# Altium schematic sheet CAN_BUS_PCA82C251T.SchDoc
size A3
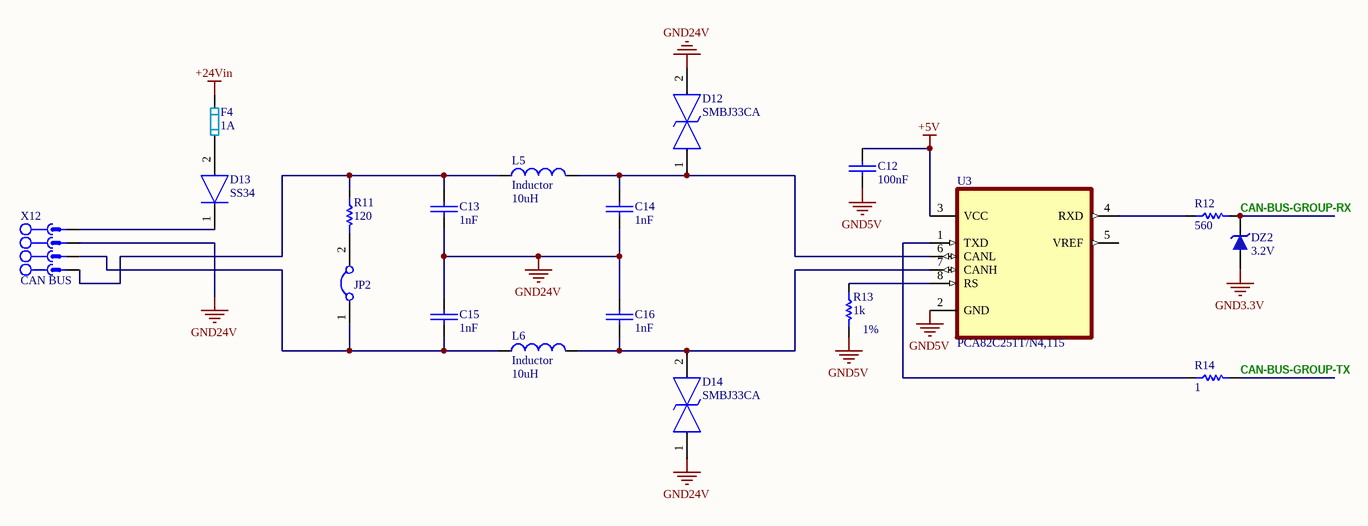
[diagram p0: CAN_BUS_PCA82C251T.SchDoc]

## Parts
C12  100nF  [CAP_SMD_0805]
C13  1nF  [CAP_SMD_0805]
C14  1nF  [CAP_SMD_0805]
C15  1nF  [CAP_SMD_0805]
C16  1nF  [CAP_SMD_0805]
D12  SMBJ33CA  [DIONM5436X261N]
D13  SS34  [DIOM6959X262N]
D14  SMBJ33CA  [DIONM5436X261N]
DZ2  3.2V  [SOD80, LL-34]
F4  value 1A  [Reset Fuse]  (hidden comment: FUSE)
JP2  Jumper  [Jumper Small - 2.54 - GRAY]  (value not drawn)
L5  Inductor  value 10uH  [INDC1206]
L6  Inductor  value 10uH  [INDC1206]
R11  120  [RES 0805 (2012X06L)]
R12  560  [RES 0805 (2012X06L)]
R13  Tolerance: 1%  [RES 0805 (2012X06L)]  (hidden comment: 1k)
R14  1  [RES 0805 (2012X06L)]
U3  PCA82C251T/N4,115  [SOIC127P600X175-8N]
X12  CAN BUS  [CON_MSTBA04]

## Nets
+5V: C12.1(+) U3.3(VCC)
+24Vin: F4.2
GND3.3V: DZ2.1
GND5V: C12.2(-) R13.2 U3.2(GND)
GND24V: C13.2(-) C14.2(-) C15.1(+) C16.1(+) D12.2 D14.1 X12.3
CAN-BUS-GROUP-RX: DZ2.2 R12.2
CAN-BUS-GROUP-TX: R14.2
NetC13_1: C13.1(+) L5.1 R11.1 X12.1
NetC14_1: C14.1(+) D12.1 L5.2 U3.6(CANL)
NetC15_2: C15.2(-) JP2.1 L6.1 X12.2
NetC16_2: C16.2(-) D14.2 L6.2 U3.7(CANH)
NetD13_1: D13.1(K) X12.4
NetD13_2: D13.2(A) F4.1
NetJP2_2: JP2.2 R11.2
NetR12_1: R12.1 U3.4(RXD)
NetR13_1: R13.1 U3.8(RS)
NetR14_1: R14.1 U3.1(TXD)

Not connected (* = marked no-connect by the designer): U3 5(VREF)

## Notes on the sheet
- Title
- Size:
- Date:
- A3
- Number:
- Time:
- Revision:
- Sheet
- of
- File:

## Library data of the parts
C12 = Cap-Bipolar: Bipolar Capacitor; Voltage: 100V; Designer: Saeid Jorablo; Organazation: ControTec; Adding Date: 1387/12/20; Value: 100nF
C13-C16 = Cap-Bipolar: Bipolar Capacitor; Voltage: 50V; Value: 1nF
D12 D14 = SMBJ33CA: TVS Diode (Bi-directional); Manufacturer_Name: LITTELFUSE; Datasheet Link: https://www.arrow.com/en/products/smbj33ca/littelfuse; Height: 2.61mm; Manufacturer_Part_Number: SMBJ33CA; Mouser Part Number: 576-SMBJ33CA; Mouser Price/Stock: https://www.mouser.co.uk/ProductDetail/Littelfuse/SMBJ33CA?qs=JJML70Qc14vzMDBYQJ3rYw%3D%3D; Arrow Part Number: SMBJ33CA; Arrow Price/Stock: https://www.arrow.com/en/products/smbj33ca/littelfuse?region=nac
D13 = SS34: Diode; Manufacturer_Name: HY Electronic Corp; Datasheet Link: http://www.hygroup.com.tw/upfiles/ADUpload/all_/SS32%20thru%20SS310(242-243).pdf; Height: 2.62mm; Manufacturer_Part_Number: SS34
DZ2 = ZENER GENERAL DIODE: DIODE ZENER GENERAL; Published: 2017-1-12; PackageVersion: 2017-1-12; PackageReference: DO 35; Publisher: Abbas Basereh; PackageDescription: DIODE GEN ZENER; ComponentLink1Description: Manufacturer Link; ComponentLink2Description: Datasheet; VALUE: 3.2V
F4 = FUSE: PART NUMBER: PPTC-FUSE-30V1A
JP2 = Jumper: Company: E.P.I.L; Defualt State: Close; Design Date: 2011/11/02
L5 L6 = Inductor: Code_IEC: 1005; Published: 8-Jun-2000; LatestRevisionDate: 29-May-2009; LatestRevisionNote: IPC-7351 Footprint Added.; PackageReference: 1206-A; Publisher: Altium Limited; PackageDescription: Chip Inductor; Code_JEITA: 1206
R11 R12 R14 = Resistor: Tolerance: 5%; Power: 1/8 W
  R11: Value: 120
  R12: Value: 560
  R14: Value: 1
R13 = Resistor: Power: 1/8 W; Value: 1k
U3 = PCA82C250T/N4,115: CAN controller interface; Package: None; Price: None; Value: *; MP: PCA82C251T/N4,115; Availability: Unavailable
X12 = CON_Phoenix_MSTBA_04: Manufacturer: PHOENIX CONTACT; Company: SJ Libraries; Connector type: PCB Terminal Block; designer: Eng. Saeid Jorablo; Max Current: 12 A; Positions: 4; Revision 1: 2012/10/1 : Adding Model; Voltage: 320 V; Category: Connector; ComponentLink1Description: Datasheet; ComponentLink2Description: Reference; HelpURL: http://s3.picofile.com/file/7443264187/Coming_Soon_logo.gif; Mounting Technology: Through-Hole; Pin Count: 4; Publisher: SJ UnLimited; Status: Unreleased; Update: 2012/10/1